# Altium project MVP-Dash-v1.0.PrjPcb (part 6 of 15)

## Sheet RK3568-VO-Interface-1.SchDoc
size 420 x 297 mm; SheetNumber: 11; SheetTotal: 25
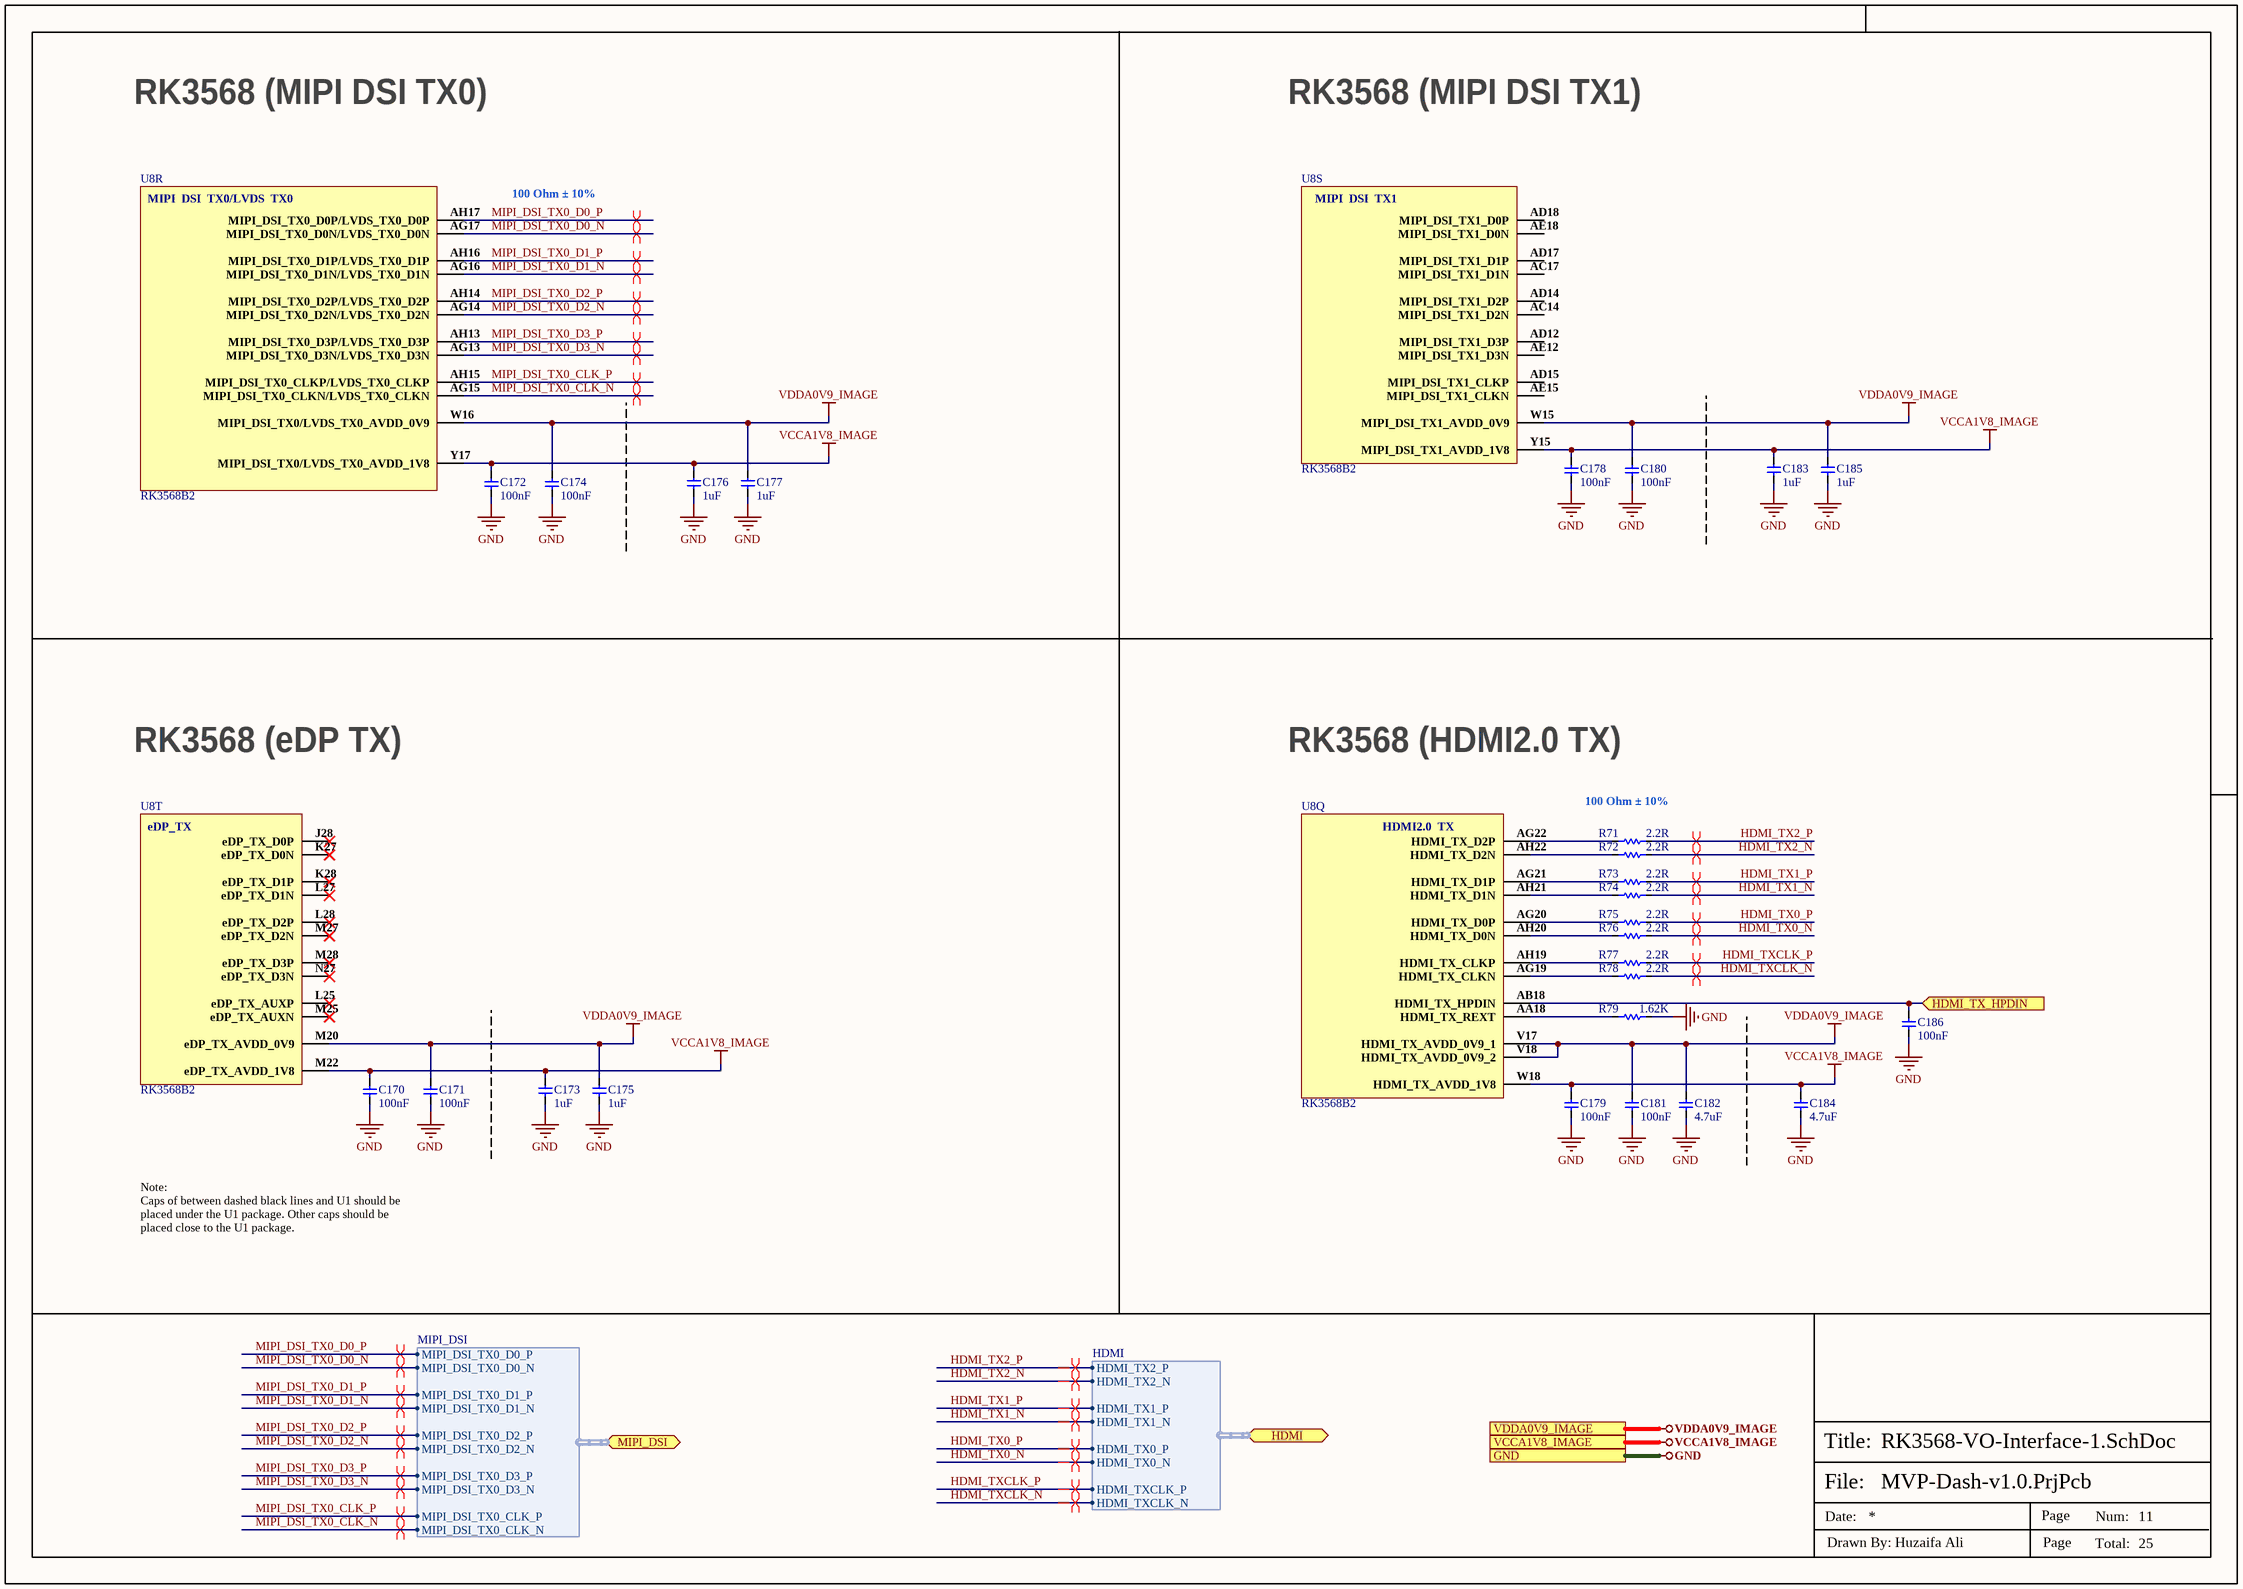
[diagram p15: RK3568-VO-Interface-1.SchDoc]

### Parts
C170  100nF  [CAP-0201]
C171  100nF  [CAP-0201]
C172  100nF  [CAP-0201]
C173  1uF  [Cap-0402]
C174  100nF  [CAP-0201]
C175  1uF  [Cap-0402]
C176  1uF  [Cap-0402]
C177  1uF  [Cap-0402]
C178  100nF  [CAP-0201]
C179  100nF  [CAP-0201]
C180  100nF  [CAP-0201]
C181  100nF  [CAP-0201]
C182  4.7uF  [Cap-0402]
C183  1uF  [Cap-0402]
C184  4.7uF  [Cap-0402]
C185  1uF  [Cap-0402]
C186  100nF  [CAP-0201]
R71  2.2R  [Res-0402]
R72  2.2R  [Res-0402]
R73  2.2R  [Res-0402]
R74  2.2R  [Res-0402]
R75  2.2R  [Res-0402]
R76  2.2R  [Res-0402]
R77  2.2R  [Res-0402]
R78  2.2R  [Res-0402]
R79  1.62K  [Res-0201]
U8  RK3568B2  [FCCSP-636L]  (parts Q,R,S,T of 23)

### Ports
GND (see Connector-Sheet[5D], DRAM-LPDDR4x-Sheet[4D], eMMC-Sheet[4D], LED-Debug-Sheet[4D], MicroSD-SPI-Flash-Sheet[4D], Power-DC-IN-Sheet[4D], Power-Others-Sheet[4D], Power-PMIC-Sheet[4D], RK3568-Audio-Interface[4D], RK3568-Flash-SD-Controller[4D], RK3568-OSC-PMUIO-Sheet[5D], RK3568-Power-Sheet[4D], RK3568-SARADC-GPIO[4D], RK3568-USB-PCIe-Sheet[5D], RK3568-VI-Interface-Sheet[4D], RK3568-VO-Interface-2[4D], Sensors-Sheet-1[4D], Sensors-Sheet-2[5D], Type-C-Sheet[4D], USB-Ports[4D], VO-HDMI2.0-TX-Sheet[4D], VO-LCM-MIPI-DSI-TX0[4D], WIFI-BT-SDIO-Sheet[4D]), HDMI (bidir, harness HDMI, see VO-HDMI2.0-TX-Sheet[2D]), HDMI_TX_HPDIN (in, see VO-HDMI2.0-TX-Sheet[1C]), MIPI_DSI (bidir, harness MIPI_DSI, see VO-LCM-MIPI-DSI-TX0[2D]), VCCA1V8_IMAGE (see Power-PMIC-Sheet[4D], RK3568-VI-Interface-Sheet[4D]), VDDA0V9_IMAGE (see Power-PMIC-Sheet[3D], RK3568-VI-Interface-Sheet[4D])

### Harnesses
MIPI_DSI: MIPI_DSI_TX0_D0_P, MIPI_DSI_TX0_D0_N, MIPI_DSI_TX0_D1_P, MIPI_DSI_TX0_D1_N, MIPI_DSI_TX0_D2_P, MIPI_DSI_TX0_D2_N, MIPI_DSI_TX0_D3_P, MIPI_DSI_TX0_D3_N, MIPI_DSI_TX0_CLK_P, MIPI_DSI_TX0_CLK_N
HDMI: HDMI_TX2_P, HDMI_TX2_N, HDMI_TX1_P, HDMI_TX1_N, HDMI_TX0_P, HDMI_TX0_N, HDMI_TXCLK_P, HDMI_TXCLK_N

### Nets
GND: C170.1 C171.1 C172.1 C173.2 C174.1 C175.2 C176.2 C177.2 C178.1 C179.1 C180.1 C181.1 C182.1 C183.2 C184.1 C185.2 C186.1 R79.2 ; port GND
VCCA1V8_IMAGE: C170.2 C172.2 C173.1 C176.1 C178.2 C179.2 C183.1 C184.2 U8.M22(eDP_TX_AVDD_1V8) U8.W18(HDMI_TX_AVDD_1V8) U8.Y15(MIPI_DSI_TX1_AVDD_1V8) U8.Y17(MIPI_DSI_TX0/LVDS_TX0_AVDD_1V8) ; port VCCA1V8_IMAGE
VDDA0V9_IMAGE: C171.2 C174.2 C175.1 C177.1 C180.2 C181.2 C182.2 C185.1 U8.M20(eDP_TX_AVDD_0V9) U8.V17(HDMI_TX_AVDD_0V9_1) U8.V18(HDMI_TX_AVDD_0V9_2) U8.W15(MIPI_DSI_TX1_AVDD_0V9) U8.W16(MIPI_DSI_TX0/LVDS_TX0_AVDD_0V9) ; port VDDA0V9_IMAGE
HDMI_TX0_N: R76.2 ; port HDMI.HDMI_TX0_N
HDMI_TX0_P: R75.2 ; port HDMI.HDMI_TX0_P
HDMI_TX1_N: R74.2 ; port HDMI.HDMI_TX1_N
HDMI_TX1_P: R73.2 ; port HDMI.HDMI_TX1_P
HDMI_TX2_N: R72.2 ; port HDMI.HDMI_TX2_N
HDMI_TX2_P: R71.2 ; port HDMI.HDMI_TX2_P
HDMI_TXCLK_N: R78.2 ; port HDMI.HDMI_TXCLK_N
HDMI_TXCLK_P: R77.2 ; port HDMI.HDMI_TXCLK_P
MIPI_DSI_TX0_CLK_N: U8.AG15(MIPI_DSI_TX0_CLKN/LVDS_TX0_CLKN) ; port MIPI_DSI.MIPI_DSI_TX0_CLK_N
MIPI_DSI_TX0_CLK_P: U8.AH15(MIPI_DSI_TX0_CLKP/LVDS_TX0_CLKP) ; port MIPI_DSI.MIPI_DSI_TX0_CLK_P
MIPI_DSI_TX0_D0_N: U8.AG17(MIPI_DSI_TX0_D0N/LVDS_TX0_D0N) ; port MIPI_DSI.MIPI_DSI_TX0_D0_N
MIPI_DSI_TX0_D0_P: U8.AH17(MIPI_DSI_TX0_D0P/LVDS_TX0_D0P) ; port MIPI_DSI.MIPI_DSI_TX0_D0_P
MIPI_DSI_TX0_D1_N: U8.AG16(MIPI_DSI_TX0_D1N/LVDS_TX0_D1N) ; port MIPI_DSI.MIPI_DSI_TX0_D1_N
MIPI_DSI_TX0_D1_P: U8.AH16(MIPI_DSI_TX0_D1P/LVDS_TX0_D1P) ; port MIPI_DSI.MIPI_DSI_TX0_D1_P
MIPI_DSI_TX0_D2_N: U8.AG14(MIPI_DSI_TX0_D2N/LVDS_TX0_D2N) ; port MIPI_DSI.MIPI_DSI_TX0_D2_N
MIPI_DSI_TX0_D2_P: U8.AH14(MIPI_DSI_TX0_D2P/LVDS_TX0_D2P) ; port MIPI_DSI.MIPI_DSI_TX0_D2_P
MIPI_DSI_TX0_D3_N: U8.AG13(MIPI_DSI_TX0_D3N/LVDS_TX0_D3N) ; port MIPI_DSI.MIPI_DSI_TX0_D3_N
MIPI_DSI_TX0_D3_P: U8.AH13(MIPI_DSI_TX0_D3P/LVDS_TX0_D3P) ; port MIPI_DSI.MIPI_DSI_TX0_D3_P
NetC186_2: C186.2 U8.AB18(HDMI_TX_HPDIN) ; port HDMI_TX_HPDIN
NetR71_1: R71.1 U8.AG22(HDMI_TX_D2P)
NetR72_1: R72.1 U8.AH22(HDMI_TX_D2N)
NetR73_1: R73.1 U8.AG21(HDMI_TX_D1P)
NetR74_1: R74.1 U8.AH21(HDMI_TX_D1N)
NetR75_1: R75.1 U8.AG20(HDMI_TX_D0P)
NetR76_1: R76.1 U8.AH20(HDMI_TX_D0N)
NetR77_1: R77.1 U8.AH19(HDMI_TX_CLKP)
NetR78_1: R78.1 U8.AG19(HDMI_TX_CLKN)
NetR79_1: R79.1 U8.AA18(HDMI_TX_REXT)

Not connected (* = marked no-connect by the designer): U8 AC14(MIPI_DSI_TX1_D2N) AC17(MIPI_DSI_TX1_D1N) AD12(MIPI_DSI_TX1_D3P) AD14(MIPI_DSI_TX1_D2P) AD15(MIPI_DSI_TX1_CLKP) AD17(MIPI_DSI_TX1_D1P) AD18(MIPI_DSI_TX1_D0P) AE12(MIPI_DSI_TX1_D3N) AE15(MIPI_DSI_TX1_CLKN) AE18(MIPI_DSI_TX1_D0N) J28(eDP_TX_D0P)* K27(eDP_TX_D0N)* K28(eDP_TX_D1P)* L25(eDP_TX_AUXP)* L27(eDP_TX_D1N)* L28(eDP_TX_D2P)* M25(eDP_TX_AUXN)* M27(eDP_TX_D2N)* M28(eDP_TX_D3P)* N27(eDP_TX_D3N)*

### Layout directives
differential pair: HDMI_TX0_N, HDMI_TX0_P, HDMI_TX1_N, HDMI_TX1_P, HDMI_TX2_N, HDMI_TX2_P, HDMI_TXCLK_N, HDMI_TXCLK_P, MIPI_DSI_TX0_CLK_N, MIPI_DSI_TX0_CLK_P, MIPI_DSI_TX0_D0_N, MIPI_DSI_TX0_D0_P, MIPI_DSI_TX0_D1_N, MIPI_DSI_TX0_D1_P, MIPI_DSI_TX0_D2_N, MIPI_DSI_TX0_D2_P, MIPI_DSI_TX0_D3_N, MIPI_DSI_TX0_D3_P

### Notes on the sheet
- RK3568 (MIPI DSI TX0)
- RK3568 (MIPI DSI TX1)
- 100 Ohm ± 10%
- RK3568 (eDP TX)
- RK3568 (HDMI2.0 TX)
- Note:
  Caps of between dashed black lines and U1 should be placed under the U1 package. Other caps should be placed close to the U1 package.
- File:
- Title:
- Date:
- Page
- Num:
- Total:
- Drawn By: Huzaifa Ali
- (in symbol RK3568B2, part Q) HDMI2.0  TX
- (in symbol RK3568B2, part R) MIPI  DSI  TX0/LVDS  TX0
- (in symbol RK3568B2, part S) MIPI  DSI  TX1
- (in symbol RK3568B2, part T) eDP_TX

### Library data of the parts
C170-C172 C174 C178-C181 C186 = CC0201KRX5R6BB104: as C124-C131 on sheet RK3568-OSC-PMUIO-Sheet; Supplier 1: Mouser; Manufacturer Part Number: CC0201KRX5R6BB104; RoHS: Yes; Category: Ceramic Capacitors; Stock 1: 824403; Pricing 1: 1=0.10000, 10=0.02400, 50=0.02400, 100=0.01900, 1000=0.01100, 10000=0.00900 (USD); Mount: Surface Mount; Case/Package: 0201; Case Code (Imperial): 0201; Case Code (Metric): 0603; Weight: 6E-06oz; Min Operating Temperature: -55°C; Max Operating Temperature: 85°C; Capacitance: 100nF; Dielectric: X5R; Voltage Rating (DC): 10V; Packaging: Tape and Reel; Termination: SMD/SMT; Resistor Type: Ceramic; Voltage Rating: 10V; Series: CC; Construction: Flat; Length: 0.6mm; Width: 0.012inch; Height: 0.3mm; Thickness: 0.013inch; Depth: 0.3mm; Radiation Hardening: No; Lead Free: Lead Free; Halogen Free: Halogen Free; RoHS Compliant: Yes; ComponentLink1URL: https://datasheet.ciiva.com/11587/upy-gphc-x5r-4v-to-50v-12-11587190.pdf?src-supplier=Avnet; ComponentLink1Description: https://datasheet.ciiva.com/11587/upy-gphc-x5r-4v-to-50v-12-11587190.pdf?src-supplier=Avnet; Supplier Part Number 1: 603-CC201KRX5R6BB104; LCSC Part Number: C190183
C173 C175-C177 C183 C185 = CC0402KRX5R6BB105: as C119-C122 on sheet RK3568-OSC-PMUIO-Sheet; Supplier 1: Mouser; Manufacturer Part Number: CC0402KRX5R6BB105; RoHS: Yes; Category: Ceramic Capacitors; Stock 1: 6711367; Pricing 1: 1=0.11000, 10=0.05500, 50=0.05500, 100=0.03300, 500=0.02700, 1000=0.02200, 2500=0.02100, 10000=0.01800 (USD); Mount: Surface Mount; Case/Package: 0402; Number of Pins: 2; Case Code (Metric): 1005; Case Code (Imperial): 0402; Min Operating Temperature: -55°C; Max Operating Temperature: 85°C; Capacitance: 1uF; Dielectric: X5R; Package Quantity: 1; Voltage Rating: 10V; Packaging: Tape and Reel; Voltage Rating (DC): 10V; Termination: SMD/SMT; Resistor Type: Ceramic; Series: CC; Construction: Flat; Length: 1mm; Width: 0.02inch; Height: 0.5mm; Thickness: 0.022inch; Depth: 0.5mm; Radiation Hardening: No; REACH SVHC: No SVHC; Lead Free: Lead Free; Halogen Free: Halogen Free; RoHS Compliant: Yes; ComponentLink1URL: https://datasheet.ciiva.com/176/upy-gphc-x5r-4v-to-50v-12-176704.pdf?src-supplier=Digi-Key; ComponentLink1Description: https://datasheet.ciiva.com/176/upy-gphc-x5r-4v-to-50v-12-176704.pdf?src-supplier=Digi-Key; ComponentLink2URL: https://datasheet.ciiva.com/176/mlccorderingcode-176705.pdf?src-supplier=Digi-Key; ComponentLink2Description: https://datasheet.ciiva.com/176/mlccorderingcode-176705.pdf?src-supplier=Digi-Key; ComponentLink3URL: https://datasheet.ciiva.com/176/mlccorderingcode-176706.pdf?src-supplier=Digi-Key; ComponentLink3Description: https://datasheet.ciiva.com/176/mlccorderingcode-176706.pdf?src-supplier=Digi-Key; Supplier Part Number 1: 603-CC402KRX5R6BB105; LCSC Part Number: C106254
C182 C184 = CC0402KRX5R5BB475: CAP CER 4.7UF 6.3V X5R 0402; Manufacturer: Yageo; Tolerance: 10%; Item Type: Capacitor; Supplier 1: Arrow Electronics; Manufacturer Part Number: CC0402KRX5R5BB475; RoHS: Yes; Category: Ceramic Capacitors; Stock 1: 890000; Pricing 1: 10000=0.02120, 20000=0.02030, 30000=0.02010, 50000=0.01930, 100000=0.01760, 250000=0.01630 (USD); Case/Package: 0402; Voltage Rating (DC): 6.3V; Dielectric: X5R; Capacitance: 4.7uF; Lead Free: Lead Free; Halogen Free: Halogen Free; RoHS Compliant: Yes; ComponentLink1URL: http://www.yageo.com/documents/recent/UPY-GPHC_X5R_4V-to-50V_25.pdf?src-supplier=Digi-Key; ComponentLink1Description: http://www.yageo.com/documents/recent/UPY-GPHC_X5R_4V-to-50V_25.pdf?src-supplier=Digi-Key; ComponentLink2URL: https://www.yageo.com/upload/media/product/productsearch/datasheet/mlcc/UPY-GPHC_X5R_4V-to-50V_26.pdf?src-supplier=Digi-Key; ComponentLink2Description: https://www.yageo.com/upload/media/product/productsearch/datasheet/mlcc/UPY-GPHC_X5R_4V-to-50V_26.pdf?src-supplier=Digi-Key; LCSC Part Number: C541466; Supplier Part Number 1: CC0402KRX5R5BB475
R71-R78 = RC0402FR-072R2L: RES 2.2 OHM 1% 1/16W 0402; Manufacturer: Yageo; Power Rating: 63mW; Voltage Rating: 50V; Temperature Coefficient: 200ppm/°C; Supplier 1: Digi-Key; Manufacturer Part Number: RC0402FR-072R2L; RoHS: Yes; Category: Chip SMD Resistors; Stock 1: 828995; Pricing 1: 1=0.10000, 10=0.02300, 100=0.00930, 1000=0.00416, 2500=0.00361, 5000=0.00298 (USD); Case/Package: 0402; Number of Pins: 2; Case Code (Imperial): 0402; Case Code (Metric): 1005; Size Code: 0402; Min Operating Temperature: -55°C; Max Operating Temperature: 155°C; Resistor Type: Thick Film; Resistance: 2.2R; Tolerance: 1%; Packaging: Tape and Reel; Termination: SMD/SMT; Voltage Rating (DC): 50V; Features: Moisture Resistant; Series: RC; Max Power Dissipation: 63mW; Number of Terminations: 2; Resistance Tolerance: 1%; Technology: THICK FILM; Length: 1mm; Width: 0.5mm; Height: 0.32mm; Depth: 0.5mm; RoHS Compliant: Yes; REACH SVHC: No SVHC; Lead Free: Lead Free; ComponentLink1URL: https://datasheet.ciiva.com/11808/0900766b80c66297-11808447.pdf?src-supplier=RSComponents; ComponentLink1Description: https://datasheet.ciiva.com/11808/0900766b80c66297-11808447.pdf?src-supplier=RSComponents; ComponentLink2URL: https://datasheet.ciiva.com/7849/1018594-7849944.pdf?src-supplier=Element14; ComponentLink2Description: https://datasheet.ciiva.com/7849/1018594-7849944.pdf?src-supplier=Element14; ComponentLink3URL: https://datasheet.ciiva.com/7849/1018594-7849945.pdf?src-supplier=Element14; ComponentLink3Description: https://datasheet.ciiva.com/7849/1018594-7849945.pdf?src-supplier=Element14; ComponentLink4URL: https://datasheet.ciiva.com/12668/pyu-rc0402-51-rohs-l-6-r-12668221.pdf?src-supplier=Mouser; ComponentLink4Description: https://datasheet.ciiva.com/12668/pyu-rc0402-51-rohs-l-6-r-12668221.pdf?src-supplier=Mouser; ComponentLink5URL: https://datasheet.ciiva.com/17070/pyu-rc0402-51-rohs-l-6-r-17070495.pdf?src-supplier=Future+Electronics; ComponentLink5Description: https://datasheet.ciiva.com/17070/pyu-rc0402-51-rohs-l-6-r-17070495.pdf?src-supplier=Future+Electronics; Supplier Part Number 1: 311-2.20LRCT-ND; LCSC Part Number: C327251
R79 = RC0201DR-071K62L: RES 1.62K OHM 0.5% 1/20W 0201; Manufacturer: Yageo; Value: 1.62kR; Max Power Dissipation: 50mW; Temperature Coefficient: 200ppm/°C; Item Type: Resistor; Supplier: Avnet; Supplier Part Number: RC0201DR-071K62L; Manufacturer Part Number: RC0201DR-071K62L; RoHS: Yes; Category: Chip SMD Resistors; Pricing: 10000=0.01131 (USD); Case/Package: 0201; Min Operating Temperature: -55°C; Max Operating Temperature: 125°C; Packaging: Tape and Reel; Number of Terminations: 2; Tolerance: 0.5%; Features: Moisture Resistant; Series: RC; Length: 0.024inch; Width: 0.012inch; Height: 0.01inch; RoHS Compliant: Yes; ComponentLink1URL: http://www.yageo.com.tw/exep/pages/download/literatures/PYu-R_INT-thick_7.pdf?src-supplier=Digikey; ComponentLink1Description: http://www.yageo.com.tw/exep/pages/download/literatures/PYu-R_INT-thick_7.pdf?src-supplier=Digikey; LCSC Part Number: C851673
U8 = RK3568B2: FCCSP-636L Microcontroller Units (MCUs/MPUs/SOCs) ROHS; Manufacturer: Rockchip; Item Type: IC; Manufacturer Part Number: RK3568B2; Package: FCCSP-636L; LCSC Part Number: C3345225

## Sheet RK3568-VO-Interface-2.SchDoc
size 420 x 297 mm; SheetNumber: 12; SheetTotal: 25
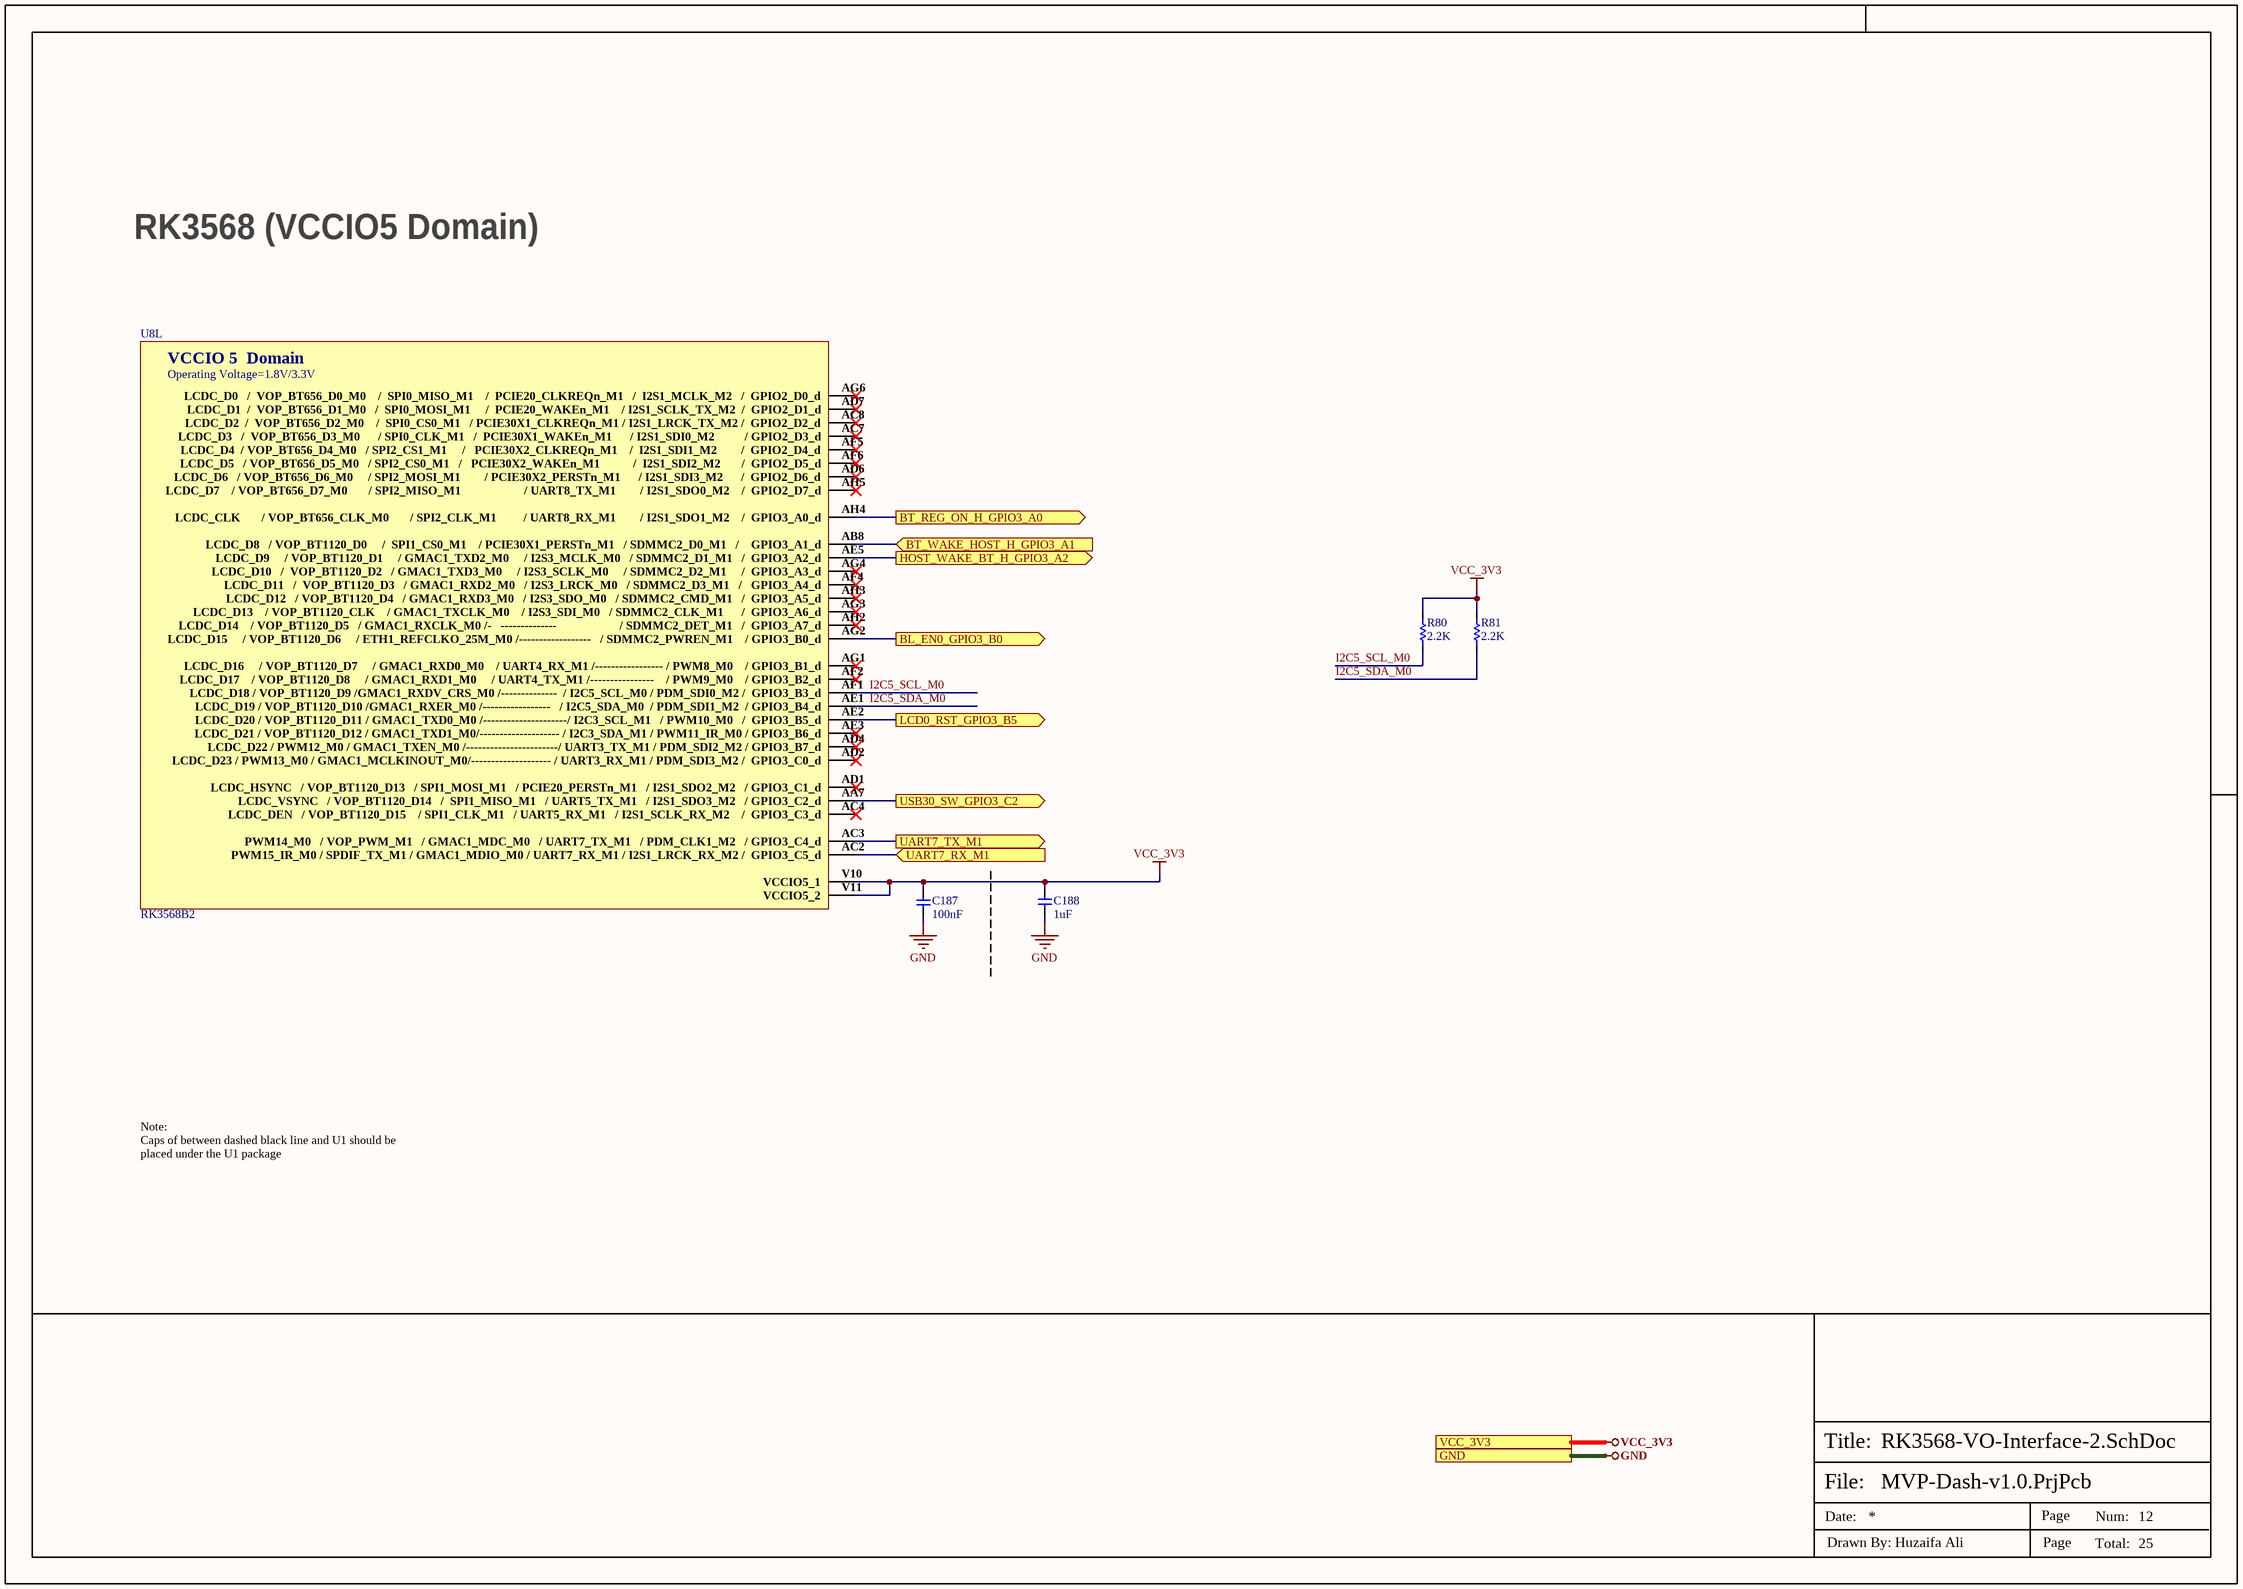
[diagram p16: RK3568-VO-Interface-2.SchDoc]

### Parts
C187  100nF  [CAP-0201]
C188  1uF  [Cap-0402]
R80  2.2K  [Res-0402]
R81  2.2K  [Res-0402]
U8  RK3568B2  [FCCSP-636L]  (part L of 23)

### Ports
BL_EN0_GPIO3_B0 (out, see VO-LCM-MIPI-DSI-TX0[3D]), BT_REG_ON_H_GPIO3_A0 (out, see WIFI-BT-SDIO-Sheet[1A]), BT_WAKE_HOST_H_GPIO3_A1 (in, see WIFI-BT-SDIO-Sheet[1B]), GND (see Connector-Sheet[5D], DRAM-LPDDR4x-Sheet[4D], eMMC-Sheet[4D], LED-Debug-Sheet[4D], MicroSD-SPI-Flash-Sheet[4D], Power-DC-IN-Sheet[4D], Power-Others-Sheet[4D], Power-PMIC-Sheet[4D], RK3568-Audio-Interface[4D], RK3568-Flash-SD-Controller[4D], RK3568-OSC-PMUIO-Sheet[5D], RK3568-Power-Sheet[4D], RK3568-SARADC-GPIO[4D], RK3568-USB-PCIe-Sheet[5D], RK3568-VI-Interface-Sheet[4D], RK3568-VO-Interface-1[4D], Sensors-Sheet-1[4D], Sensors-Sheet-2[5D], Type-C-Sheet[4D], USB-Ports[4D], VO-HDMI2.0-TX-Sheet[4D], VO-LCM-MIPI-DSI-TX0[4D], WIFI-BT-SDIO-Sheet[4D]), HOST_WAKE_BT_H_GPIO3_A2 (out, see WIFI-BT-SDIO-Sheet[1B]), LCD0_RST_GPIO3_B5 (out, see VO-LCM-MIPI-DSI-TX0[3D]), UART7_RX_M1 (in, see Sensors-Sheet-1[2B]), UART7_TX_M1 (out, see Sensors-Sheet-1[2B]), USB30_SW_GPIO3_C2 (out, see Type-C-Sheet[2B]), VCC_3V3 (see eMMC-Sheet[4D], Power-PMIC-Sheet[4D], RK3568-SARADC-GPIO[4D], RK3568-USB-PCIe-Sheet[5D], VO-HDMI2.0-TX-Sheet[4D], WIFI-BT-SDIO-Sheet[4D])

### Nets
GND: C187.1 C188.2 ; port GND
VCC_3V3: C187.2 C188.1 R80.2 R81.2 U8.V10(VCCIO5_1) U8.V11(VCCIO5_2) ; port VCC_3V3
BL_EN0_GPIO3_B0: U8.AG2(LCDC_D15_____/_VOP_BT1120_D6_____/_ETH1_REFCLKO_25M_M0_/------------------___/_SDMMC2_PWREN_M1____/_GPIO3_B0_d) ; port BL_EN0_GPIO3_B0
I2C5_SCL_M0: R80.1 U8.AF1(LCDC_D18_/_VOP_BT1120_D9_/GMAC1_RXDV_CRS_M0_/--------------__/_I2C5_SCL_M0_/_PDM_SDI0_M2_/__GPIO3_B3_d)
I2C5_SDA_M0: R81.1 U8.AE1(LCDC_D19_/_VOP_BT1120_D10_/GMAC1_RXER_M0_/-----------------___/_I2C5_SDA_M0__/_PDM_SDI1_M2__/_GPIO3_B4_d)
LCD0_RST_GPIO3_B5: U8.AE2(LCDC_D20_/_VOP_BT1120_D11_/_GMAC1_TXD0_M0_/---------------------/_I2C3_SCL_M1___/_PWM10_M0___/__GPIO3_B5_d) ; port LCD0_RST_GPIO3_B5
NetQ6_3: U8.AB8(LCDC_D8___/_VOP_BT1120_D0_____/__SPI1_CS0_M1____/_PCIE30X1_PERSTn_M1___/_SDMMC2_D0_M1___/____GPIO3_A1_d) ; port BT_WAKE_HOST_H_GPIO3_A1
NetR141_1: U8.AH4(LCDC_CLK_______/_VOP_BT656_CLK_M0_______/_SPI2_CLK_M1_________/_UART8_RX_M1________/_I2S1_SDO1_M2____/__GPIO3_A0_d) ; port BT_REG_ON_H_GPIO3_A0
NetR142_1: U8.AE5(LCDC_D9_____/_VOP_BT1120_D1_____/_GMAC1_TXD2_M0_____/_I2S3_MCLK_M0___/_SDMMC2_D1_M1___/__GPIO3_A2_d) ; port HOST_WAKE_BT_H_GPIO3_A2
NetR190_1: U8.AC3(PWM14_M0___/_VOP_PWM_M1___/_GMAC1_MDC_M0___/_UART7_TX_M1___/_PDM_CLK1_M2___/_GPIO3_C4_d) ; port UART7_TX_M1
NetR191_1: U8.AC2(PWM15_IR_M0_/_SPDIF_TX_M1_/_GMAC1_MDIO_M0_/_UART7_RX_M1_/_I2S1_LRCK_RX_M2_/__GPIO3_C5_d) ; port UART7_RX_M1
NetU8_AA7: U8.AA7(LCDC_VSYNC___/_VOP_BT1120_D14___/__SPI1_MISO_M1___/_UART5_TX_M1___/_I2S1_SDO3_M2___/_GPIO3_C2_d) ; port USB30_SW_GPIO3_C2

Not connected (* = marked no-connect by the designer): U8 AC4(LCDC_DEN___/_VOP_BT1120_D15____/_SPI1_CLK_M1___/_UART5_RX_M1___/_I2S1_SCLK_RX_M2____/__GPIO3_C3_d)* AC7(LCDC_D3___/__VOP_BT656_D3_M0______/_SPI0_CLK_M1___/__PCIE30X1_WAKEn_M1______/_I2S1_SDI0_M2__________/_GPIO2_D3_d)* AC8(LCDC_D2__/__VOP_BT656_D2_M0____/__SPI0_CS0_M1___/_PCIE30X1_CLKREQn_M1_/_I2S1_LRCK_TX_M2_/__GPIO2_D2_d)* AD1(LCDC_HSYNC___/_VOP_BT1120_D13___/_SPI1_MOSI_M1___/_PCIE20_PERSTn_M1___/_I2S1_SDO2_M2___/_GPIO3_C1_d)* AD2(LCDC_D23_/_PWM13_M0_/_GMAC1_MCLKINOUT_M0/--------------------_/_UART3_RX_M1_/_PDM_SDI3_M2_/__GPIO3_C0_d)* AD4(LCDC_D22_/_PWM12_M0_/_GMAC1_TXEN_M0_/-----------------------/_UART3_TX_M1_/_PDM_SDI2_M2_/_GPIO3_B7_d)* AD6(LCDC_D6___/_VOP_BT656_D6_M0_____/_SPI2_MOSI_M1________/_PCIE30X2_PERSTn_M1______/_I2S1_SDI3_M2______/__GPIO2_D6_d)* AD7(LCDC_D1__/__VOP_BT656_D1_M0___/__SPI0_MOSI_M1_____/__PCIE20_WAKEn_M1____/_I2S1_SCLK_TX_M2__/__GPIO2_D1_d)* AE3(LCDC_D21_/_VOP_BT1120_D12_/_GMAC1_TXD1_M0/--------------------_/_I2C3_SDA_M1_/_PWM11_IR_M0_/_GPIO3_B6_d)* AF2(LCDC_D17____/_VOP_BT1120_D8_____/_GMAC1_RXD1_M0_____/_UART4_TX_M1_/----------------____/_PWM9_M0____/_GPIO3_B2_d)* AF4(LCDC_D11___/__VOP_BT1120_D3___/_GMAC1_RXD2_M0___/_I2S3_LRCK_M0___/_SDMMC2_D3_M1___/___GPIO3_A4_d)* AF5(LCDC_D4__/_VOP_BT656_D4_M0___/_SPI2_CS1_M1_____/___PCIE30X2_CLKREQn_M1____/__I2S1_SDI1_M2________/__GPIO2_D4_d)* AF6(LCDC_D5___/_VOP_BT656_D5_M0___/_SPI2_CS0_M1___/___PCIE30X2_WAKEn_M1___________/__I2S1_SDI2_M2_______/__GPIO2_D5_d)* AG1(LCDC_D16_____/_VOP_BT1120_D7_____/_GMAC1_RXD0_M0____/_UART4_RX_M1_/-----------------_/_PWM8_M0____/_GPIO3_B1_d)* AG3(LCDC_D13____/_VOP_BT1120_CLK____/_GMAC1_TXCLK_M0____/_I2S3_SDI_M0___/_SDMMC2_CLK_M1______/__GPIO3_A6_d)* AG4(LCDC_D10___/__VOP_BT1120_D2___/_GMAC1_TXD3_M0_____/_I2S3_SCLK_M0_____/_SDMMC2_D2_M1_____/__GPIO3_A3_d)* AG6(LCDC_D0___/__VOP_BT656_D0_M0____/__SPI0_MISO_M1____/__PCIE20_CLKREQn_M1___/__I2S1_MCLK_M2___/__GPIO2_D0_d)* AH2(LCDC_D14____/_VOP_BT1120_D5___/_GMAC1_RXCLK_M0_/-___--------------_____________________/_SDMMC2_DET_M1___/__GPIO3_A7_d)* AH3(LCDC_D12___/_VOP_BT1120_D4___/_GMAC1_RXD3_M0___/_I2S3_SDO_M0___/_SDMMC2_CMD_M1___/__GPIO3_A5_d)* AH5(LCDC_D7____/_VOP_BT656_D7_M0_______/_SPI2_MISO_M1_____________________/_UART8_TX_M1________/_I2S1_SDO0_M2____/__GPIO2_D7_d)*

### Notes on the sheet
- RK3568 (VCCIO5 Domain)
- Note:
  Caps of between dashed black line and U1 should be placed under the U1 package
- File:
- Title:
- Date:
- Page
- Num:
- Total:
- Drawn By: Huzaifa Ali
- (in symbol RK3568B2, part L) VCCIO 5  Domain; Operating Voltage=1.8V/3.3V

### Library data of the parts
C187 = CC0201KRX5R6BB104: as C124-C131 on sheet RK3568-OSC-PMUIO-Sheet; Supplier 1: Mouser; Manufacturer Part Number: CC0201KRX5R6BB104; RoHS: Yes; Category: Ceramic Capacitors; Stock 1: 824403; Pricing 1: 1=0.10000, 10=0.02400, 50=0.02400, 100=0.01900, 1000=0.01100, 10000=0.00900 (USD); Mount: Surface Mount; Case/Package: 0201; Case Code (Imperial): 0201; Case Code (Metric): 0603; Weight: 6E-06oz; Min Operating Temperature: -55°C; Max Operating Temperature: 85°C; Capacitance: 100nF; Dielectric: X5R; Voltage Rating (DC): 10V; Packaging: Tape and Reel; Termination: SMD/SMT; Resistor Type: Ceramic; Voltage Rating: 10V; Series: CC; Construction: Flat; Length: 0.6mm; Width: 0.012inch; Height: 0.3mm; Thickness: 0.013inch; Depth: 0.3mm; Radiation Hardening: No; Lead Free: Lead Free; Halogen Free: Halogen Free; RoHS Compliant: Yes; ComponentLink1URL: https://datasheet.ciiva.com/11587/upy-gphc-x5r-4v-to-50v-12-11587190.pdf?src-supplier=Avnet; ComponentLink1Description: https://datasheet.ciiva.com/11587/upy-gphc-x5r-4v-to-50v-12-11587190.pdf?src-supplier=Avnet; Supplier Part Number 1: 603-CC201KRX5R6BB104; LCSC Part Number: C190183
C188 = CC0402KRX5R6BB105: as C119-C122 on sheet RK3568-OSC-PMUIO-Sheet; Supplier 1: Mouser; Manufacturer Part Number: CC0402KRX5R6BB105; RoHS: Yes; Category: Ceramic Capacitors; Stock 1: 6711367; Pricing 1: 1=0.11000, 10=0.05500, 50=0.05500, 100=0.03300, 500=0.02700, 1000=0.02200, 2500=0.02100, 10000=0.01800 (USD); Mount: Surface Mount; Case/Package: 0402; Number of Pins: 2; Case Code (Metric): 1005; Case Code (Imperial): 0402; Min Operating Temperature: -55°C; Max Operating Temperature: 85°C; Capacitance: 1uF; Dielectric: X5R; Package Quantity: 1; Voltage Rating: 10V; Packaging: Tape and Reel; Voltage Rating (DC): 10V; Termination: SMD/SMT; Resistor Type: Ceramic; Series: CC; Construction: Flat; Length: 1mm; Width: 0.02inch; Height: 0.5mm; Thickness: 0.022inch; Depth: 0.5mm; Radiation Hardening: No; REACH SVHC: No SVHC; Lead Free: Lead Free; Halogen Free: Halogen Free; RoHS Compliant: Yes; ComponentLink1URL: https://datasheet.ciiva.com/176/upy-gphc-x5r-4v-to-50v-12-176704.pdf?src-supplier=Digi-Key; ComponentLink1Description: https://datasheet.ciiva.com/176/upy-gphc-x5r-4v-to-50v-12-176704.pdf?src-supplier=Digi-Key; ComponentLink2URL: https://datasheet.ciiva.com/176/mlccorderingcode-176705.pdf?src-supplier=Digi-Key; ComponentLink2Description: https://datasheet.ciiva.com/176/mlccorderingcode-176705.pdf?src-supplier=Digi-Key; ComponentLink3URL: https://datasheet.ciiva.com/176/mlccorderingcode-176706.pdf?src-supplier=Digi-Key; ComponentLink3Description: https://datasheet.ciiva.com/176/mlccorderingcode-176706.pdf?src-supplier=Digi-Key; Supplier Part Number 1: 603-CC402KRX5R6BB105; LCSC Part Number: C106254
R80 R81 = RC0402FR-072K2L: RES SMD 2.2K OHM 1% 1/16W 0402; Manufacturer: Yageo; Resistance: 2.2kR; Power Rating: 63mW; Voltage Rating: 50V; Temperature Coefficient: 100ppm/°C; Supplier 1: Digi-Key; Manufacturer Part Number: RC0402FR-072K2L; Stock 1: 966157; Pricing 1: 1=0.1, 10=0.016, 100=0.0066, 1000=0.00299, 2500=0.00259, 5000=0.00214 (USD); Case/Package: 0402; Case Code (Imperial): 0402; Case Code (Metric): 1005; Weight: 2.3E-05oz; Size Code: 0402; Min Operating Temperature: -55°C; Max Operating Temperature: 155°C; Resistor Type: Thick Film; Packaging: Tape and Reel; Tolerance: 1%; Termination: SMD/SMT; Features: Moisture Resistant; Series: RC; Max Power Dissipation: 63mW; Number of Terminations: 2; Resistance Tolerance: 1%; Construction: Rectangular; Technology: THICK FILM; Length: 1mm; Width: 0.5mm; Height: 0.35mm; Depth: 0.5mm; RoHS Compliant: Yes; REACH SVHC: Unknown; Military Standard: Not; Lead Free: Lead Free; ComponentLink1URL: http://www.farnell.com/datasheets/2167052.pdf?src-supplier=Element14; ComponentLink1Description: http://www.farnell.com/datasheets/2167052.pdf?src-supplier=Element14; ComponentLink2URL: http://www.yageo.com/documents/recent/PYu-RC_Group_51_RoHS_L_9.pdf?src-supplier=Mouser; ComponentLink2Description: http://www.yageo.com/documents/recent/PYu-RC_Group_51_RoHS_L_9.pdf?src-supplier=Mouser; ComponentLink3URL: http://documents.rs-components.com/techlib://itc_doclist_GB.htm?stockno=6186532&src-supplier=RSComponents; ComponentLink3Description: http://documents.rs-components.com/techlib://itc_doclist_GB.htm?stockno=6186532&src-supplier=RSComponents; ComponentLink4URL: http://www.yageo.com/documents/recent/PYu-RC0402_51_RoHS_L_6_r.pdf?src-supplier=Future+Electronics; ComponentLink4Description: http://www.yageo.com/documents/recent/PYu-RC0402_51_RoHS_L_6_r.pdf?src-supplier=Future+Electronics; Supplier Part Number 1: 311-2.20KLRCT-ND; LCSC Part Number: C114762
U8 = RK3568B2: as U8 on sheet RK3568-VO-Interface-1; Manufacturer Part Number: RK3568B2; Package: FCCSP-636L; LCSC Part Number: C3345225

## Sheet RK3568-Audio-Interface.SchDoc
size 420 x 297 mm; SheetNumber: 13; SheetTotal: 25
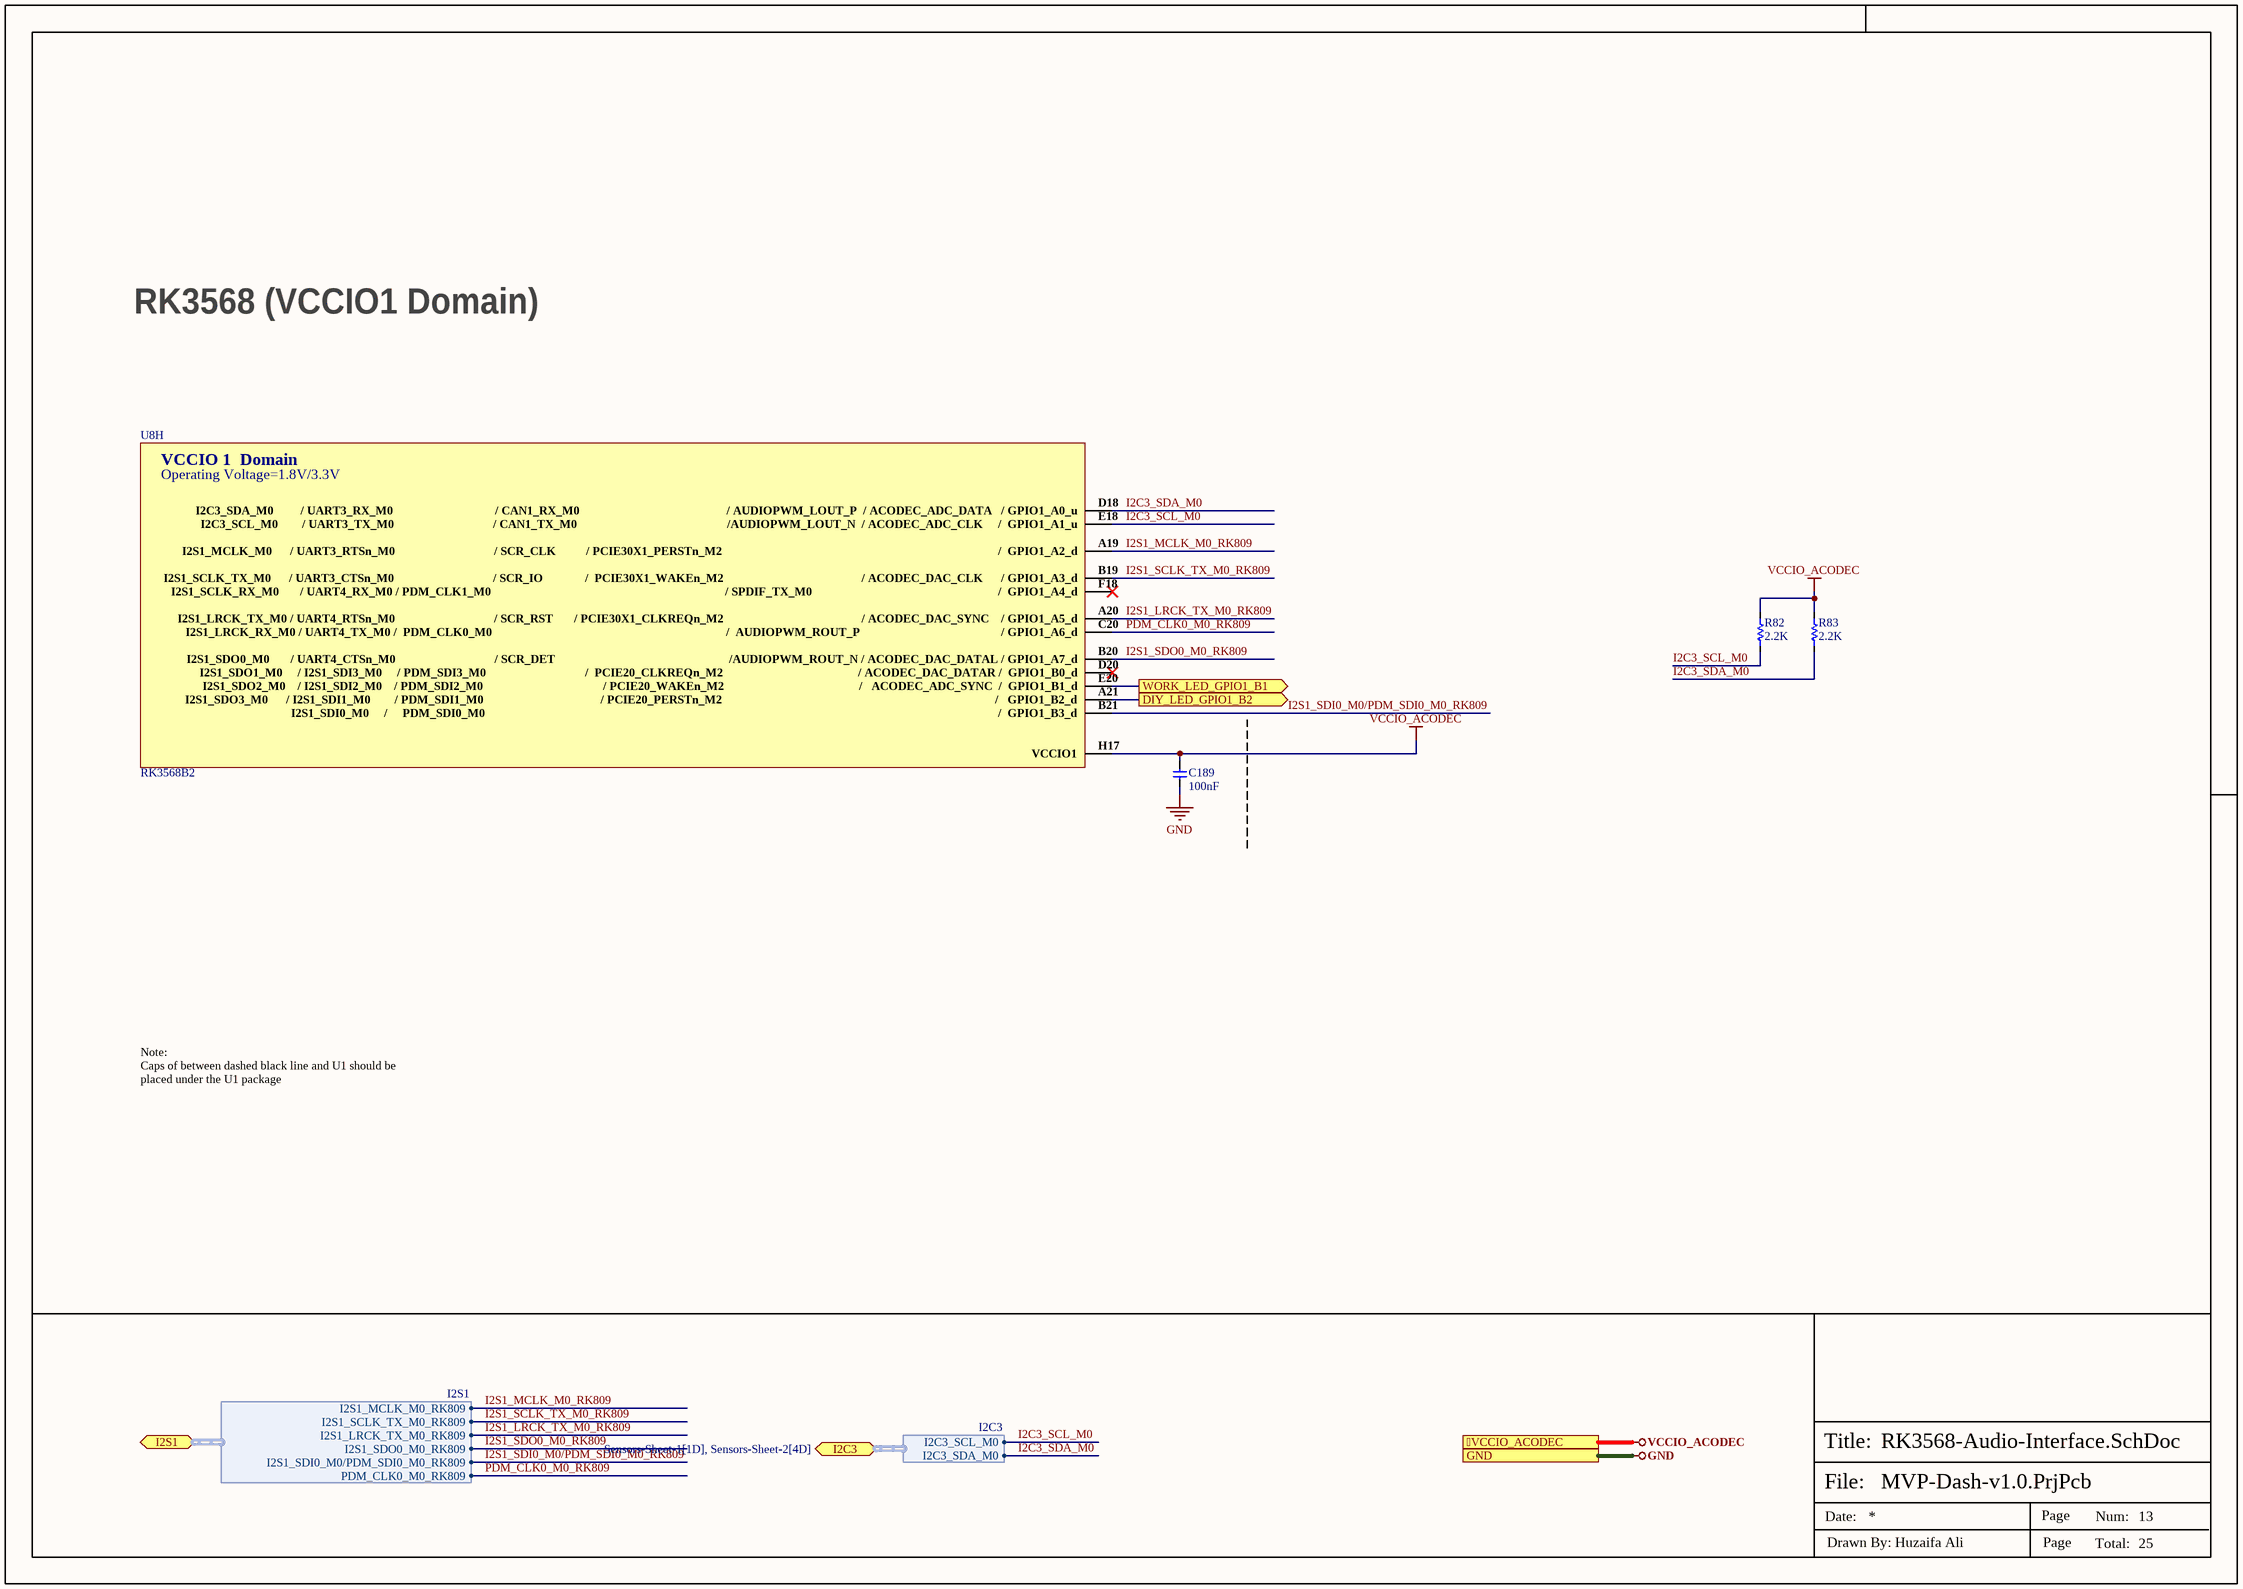
[diagram p17: RK3568-Audio-Interface.SchDoc]

### Parts
C189  100nF  [CAP-0201]
R82  2.2K  [Res-0402]
R83  2.2K  [Res-0402]
U8  RK3568B2  [FCCSP-636L]  (part H of 23)

### Ports
VCCIO_ACODEC, DIY_LED_GPIO1_B2 (out, see LED-Debug-Sheet[3C]), GND (see CAN-Bus-SPI-Flash-Sheet[4D], Connector-Sheet[5D], DRAM-LPDDR4x-Sheet[4D], eMMC-Sheet[4D], LED-Debug-Sheet[4D], Power-DC-IN-Sheet[4D], Power-Others-Sheet[4D], Power-PMIC-Sheet[4D], RK3568-Flash-SD-Controller[4D], RK3568-OSC-PMUIO-Sheet[5D], RK3568-Power-Sheet[4D], RK3568-SARADC-GPIO[4D], RK3568-USB-PCIe-Sheet[5D], RK3568-VI-Interface-Sheet[4D], RK3568-VO-Interface-1[4D], RK3568-VO-Interface-2[4D], Sensors-Sheet-1[4D], Sensors-Sheet-2[5D], Type-C-Sheet[4D], USB-Ports[4D], VO-HDMI2.0-TX-Sheet[4D], VO-LCM-MIPI-DSI-TX0[4D], WIFI-BT-SDIO-Sheet[4D]), I2C3 (bidir, harness I2C3, see Sensors-Sheet-1[1D], Sensors-Sheet-2[4D]), I2S1 (bidir, harness I2S1, see Power-PMIC-Sheet[1D]), WORK_LED_GPIO1_B1 (out, see LED-Debug-Sheet[1C])

### Harnesses
I2S1: I2S1_MCLK_M0_RK809, I2S1_SCLK_TX_M0_RK809, I2S1_LRCK_TX_M0_RK809, I2S1_SDO0_M0_RK809, I2S1_SDI0_M0/PDM_SDI0_M0_RK809, PDM_CLK0_M0_RK809
I2C3: I2C3_SCL_M0, I2C3_SDA_M0

### Nets
GND: C189.1 ; port GND
VCCIO_ACODEC: C189.2 R82.2 R83.2 U8.H17(VCCIO1) ; port VCCIO_ACODEC
I2C3_SCL_M0: R82.1 U8.E18(I2C3_SCL_M0________/_UART3_TX_M0_________________________________/_CAN1_TX_M0__________________________________________________/AUDIOPWM_LOUT_N__/_ACODEC_ADC_CLK_____/__GPIO1_A1_u) ; port I2C3.I2C3_SCL_M0
I2C3_SDA_M0: R83.1 U8.D18(I2C3_SDA_M0_________/_UART3_RX_M0__________________________________/_CAN1_RX_M0_________________________________________________/_AUDIOPWM_LOUT_P__/_ACODEC_ADC_DATA___/_GPIO1_A0_u) ; port I2C3.I2C3_SDA_M0
I2S1_LRCK_TX_M0_RK809: U8.A20(I2S1_LRCK_TX_M0_/_UART4_RTSn_M0_________________________________/_SCR_RST_______/_PCIE30X1_CLKREQn_M2______________________________________________/_ACODEC_DAC_SYNC____/_GPIO1_A5_d) ; port I2S1.I2S1_LRCK_TX_M0_RK809
I2S1_MCLK_M0_RK809: U8.A19(I2S1_MCLK_M0______/_UART3_RTSn_M0_________________________________/_SCR_CLK__________/_PCIE30X1_PERSTn_M2____________________________________________________________________________________________/__GPIO1_A2_d) ; port I2S1.I2S1_MCLK_M0_RK809
I2S1_SCLK_TX_M0_RK809: U8.B19(I2S1_SCLK_TX_M0______/_UART3_CTSn_M0_________________________________/_SCR_IO______________/__PCIE30X1_WAKEn_M2______________________________________________/_ACODEC_DAC_CLK______/_GPIO1_A3_d) ; port I2S1.I2S1_SCLK_TX_M0_RK809
I2S1_SDI0_M0/PDM_SDI0_M0_RK809: U8.B21(I2S1_SDI0_M0_____/_____PDM_SDI0_M0___________________________________________________________________________________________________________________________________________________________________________/__GPIO1_B3_d) ; port I2S1.I2S1_SDI0_M0/PDM_SDI0_M0_RK809
I2S1_SDO0_M0_RK809: U8.B20(I2S1_SDO0_M0_______/_UART4_CTSn_M0_________________________________/_SCR_DET__________________________________________________________/AUDIOPWM_ROUT_N_/_ACODEC_DAC_DATAL_/_GPIO1_A7_d) ; port I2S1.I2S1_SDO0_M0_RK809
PDM_CLK0_M0_RK809: U8.C20(I2S1_LRCK_RX_M0_/_UART4_TX_M0_/__PDM_CLK0_M0______________________________________________________________________________/__AUDIOPWM_ROUT_P_______________________________________________/_GPIO1_A6_d) ; port I2S1.PDM_CLK0_M0_RK809
NetR89_1: U8.E20(I2S1_SDO2_M0____/_I2S1_SDI2_M0____/_PDM_SDI2_M0________________________________________/_PCIE20_WAKEn_M2_____________________________________________/___ACODEC_ADC_SYNC__/__GPIO1_B1_d) ; port WORK_LED_GPIO1_B1
NetR94_1: U8.A21(I2S1_SDO3_M0______/_I2S1_SDI1_M0________/_PDM_SDI1_M0_______________________________________/_PCIE20_PERSTn_M2___________________________________________________________________________________________/___GPIO1_B2_d) ; port DIY_LED_GPIO1_B2

Not connected (* = marked no-connect by the designer): U8 D20(I2S1_SDO1_M0_____/_I2S1_SDI3_M0_____/_PDM_SDI3_M0_________________________________/__PCIE20_CLKREQn_M2_____________________________________________/_ACODEC_DAC_DATAR_/__GPIO1_B0_d)* F18(I2S1_SCLK_RX_M0_______/_UART4_RX_M0_/_PDM_CLK1_M0______________________________________________________________________________/_SPDIF_TX_M0______________________________________________________________/__GPIO1_A4_d)*

### Notes on the sheet
- RK3568 (VCCIO1 Domain)
- Note:
  Caps of between dashed black line and U1 should be placed under the U1 package
- File:
- Title:
- Date:
- Page
- Num:
- Total:
- Drawn By: Huzaifa Ali
- (in symbol RK3568B2, part H) VCCIO 1  Domain; Operating Voltage=1.8V/3.3V

### Library data of the parts
C189 = CC0201KRX5R6BB104: as C124-C131 on sheet RK3568-OSC-PMUIO-Sheet; Supplier 1: Mouser; Manufacturer Part Number: CC0201KRX5R6BB104; RoHS: Yes; Category: Ceramic Capacitors; Stock 1: 824403; Pricing 1: 1=0.10000, 10=0.02400, 50=0.02400, 100=0.01900, 1000=0.01100, 10000=0.00900 (USD); Mount: Surface Mount; Case/Package: 0201; Case Code (Imperial): 0201; Case Code (Metric): 0603; Weight: 6E-06oz; Min Operating Temperature: -55°C; Max Operating Temperature: 85°C; Capacitance: 100nF; Dielectric: X5R; Voltage Rating (DC): 10V; Packaging: Tape and Reel; Termination: SMD/SMT; Resistor Type: Ceramic; Voltage Rating: 10V; Series: CC; Construction: Flat; Length: 0.6mm; Width: 0.012inch; Height: 0.3mm; Thickness: 0.013inch; Depth: 0.3mm; Radiation Hardening: No; Lead Free: Lead Free; Halogen Free: Halogen Free; RoHS Compliant: Yes; ComponentLink1URL: https://datasheet.ciiva.com/11587/upy-gphc-x5r-4v-to-50v-12-11587190.pdf?src-supplier=Avnet; ComponentLink1Description: https://datasheet.ciiva.com/11587/upy-gphc-x5r-4v-to-50v-12-11587190.pdf?src-supplier=Avnet; Supplier Part Number 1: 603-CC201KRX5R6BB104; LCSC Part Number: C190183
R82 R83 = RC0402FR-072K2L: as R80 on sheet RK3568-VO-Interface-2; Supplier 1: Digi-Key; Manufacturer Part Number: RC0402FR-072K2L; Stock 1: 966157; Pricing 1: 1=0.1, 10=0.016, 100=0.0066, 1000=0.00299, 2500=0.00259, 5000=0.00214 (USD); Case/Package: 0402; Case Code (Imperial): 0402; Case Code (Metric): 1005; Weight: 2.3E-05oz; Size Code: 0402; Min Operating Temperature: -55°C; Max Operating Temperature: 155°C; Resistor Type: Thick Film; Packaging: Tape and Reel; Tolerance: 1%; Termination: SMD/SMT; Features: Moisture Resistant; Series: RC; Max Power Dissipation: 63mW; Number of Terminations: 2; Resistance Tolerance: 1%; Construction: Rectangular; Technology: THICK FILM; Length: 1mm; Width: 0.5mm; Height: 0.35mm; Depth: 0.5mm; RoHS Compliant: Yes; REACH SVHC: Unknown; Military Standard: Not; Lead Free: Lead Free; ComponentLink1URL: http://www.farnell.com/datasheets/2167052.pdf?src-supplier=Element14; ComponentLink1Description: http://www.farnell.com/datasheets/2167052.pdf?src-supplier=Element14; ComponentLink2URL: http://www.yageo.com/documents/recent/PYu-RC_Group_51_RoHS_L_9.pdf?src-supplier=Mouser; ComponentLink2Description: http://www.yageo.com/documents/recent/PYu-RC_Group_51_RoHS_L_9.pdf?src-supplier=Mouser; ComponentLink3URL: http://documents.rs-components.com/techlib://itc_doclist_GB.htm?stockno=6186532&src-supplier=RSComponents; ComponentLink3Description: http://documents.rs-components.com/techlib://itc_doclist_GB.htm?stockno=6186532&src-supplier=RSComponents; ComponentLink4URL: http://www.yageo.com/documents/recent/PYu-RC0402_51_RoHS_L_6_r.pdf?src-supplier=Future+Electronics; ComponentLink4Description: http://www.yageo.com/documents/recent/PYu-RC0402_51_RoHS_L_6_r.pdf?src-supplier=Future+Electronics; Supplier Part Number 1: 311-2.20KLRCT-ND; LCSC Part Number: C114762
U8 = RK3568B2: as U8 on sheet RK3568-VO-Interface-1; Manufacturer Part Number: RK3568B2; Package: FCCSP-636L; LCSC Part Number: C3345225